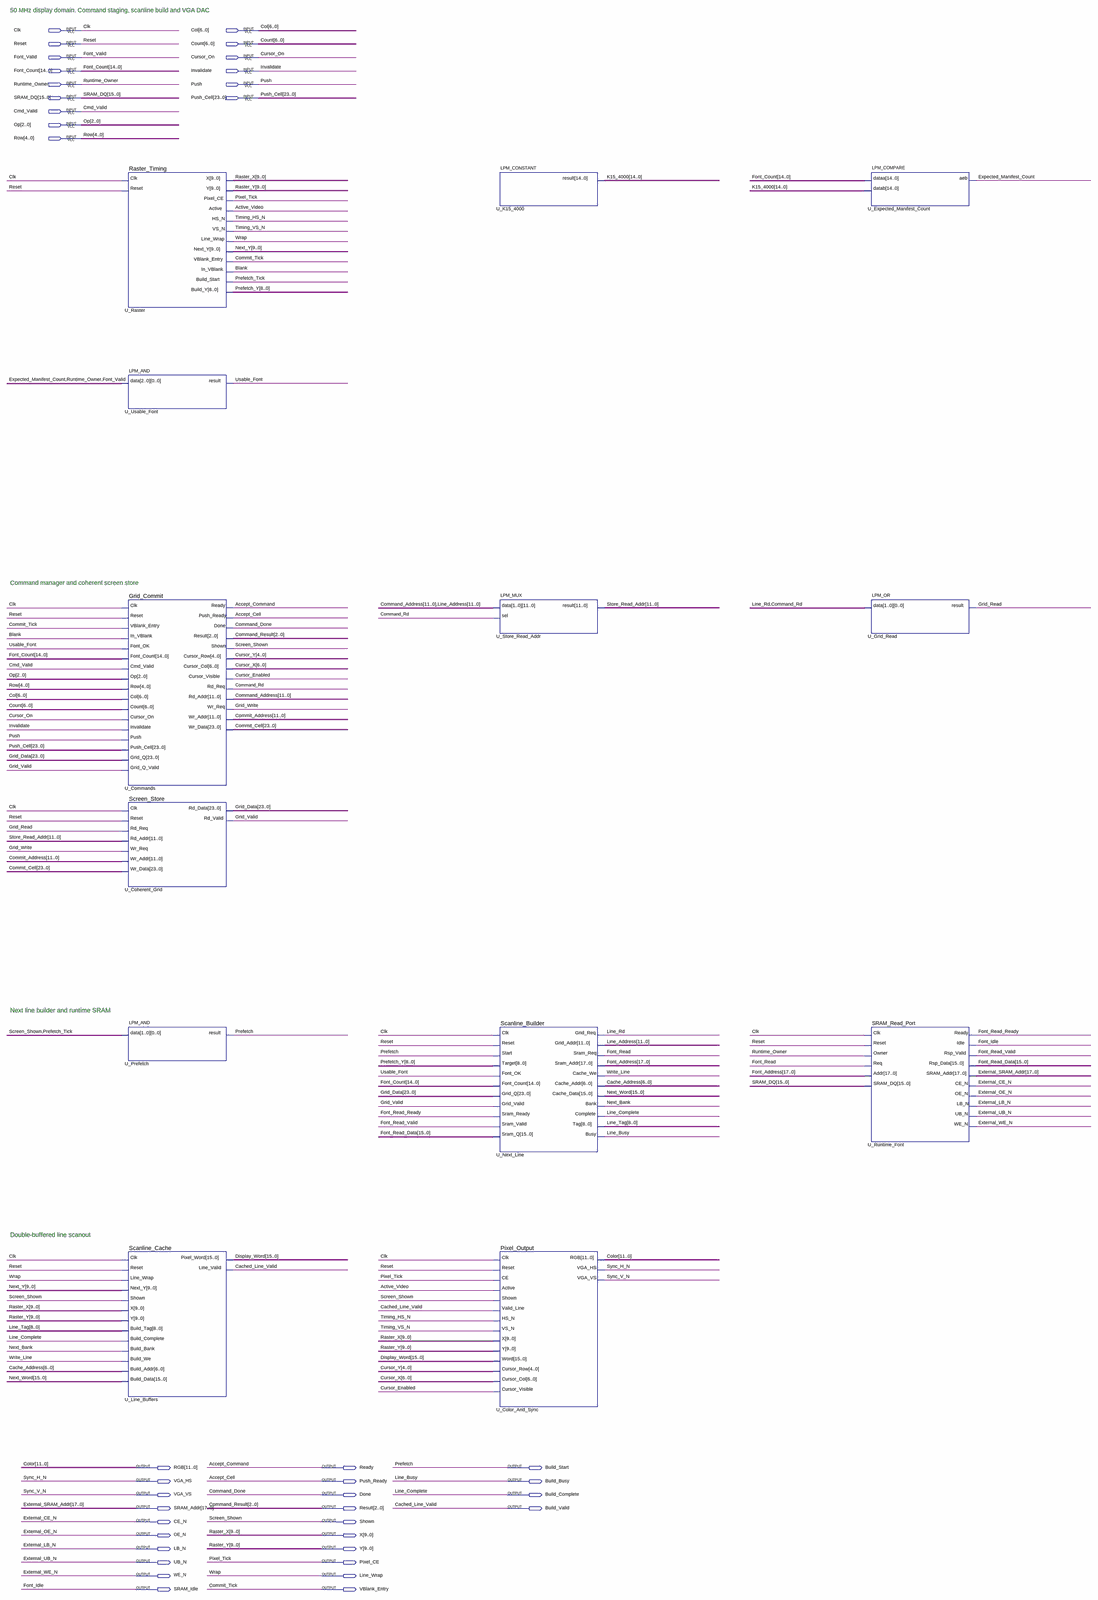
[diagram p0: schematic sheet, whole]
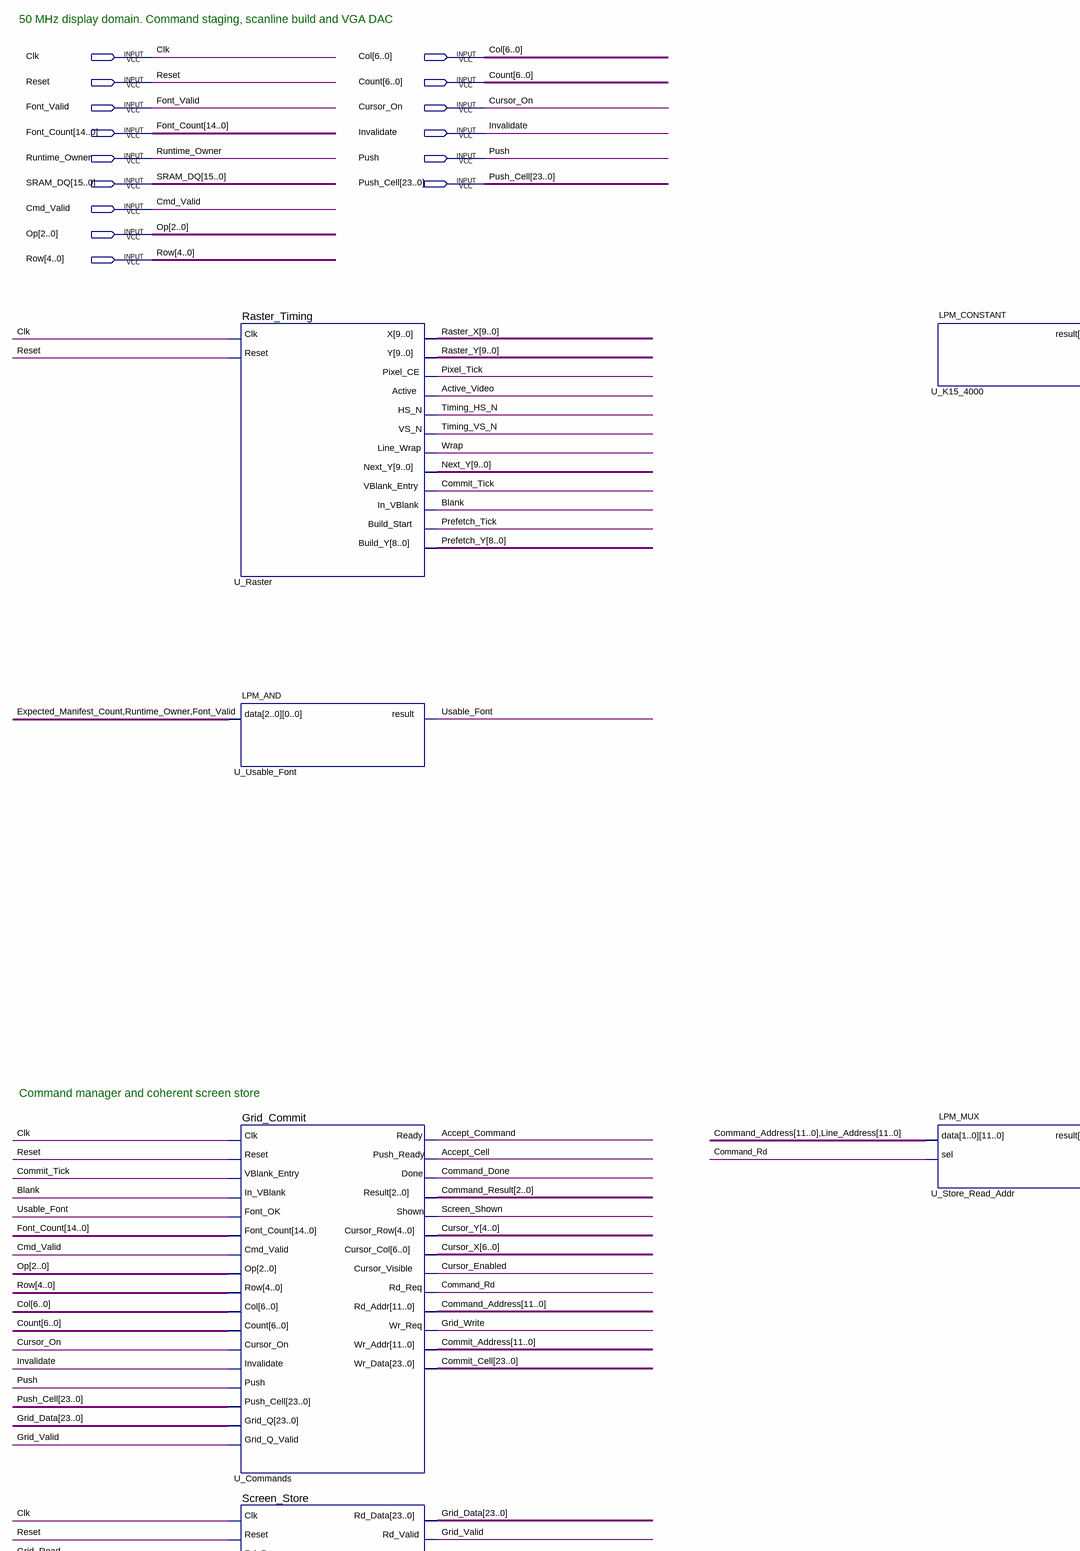
[diagram p1: schematic sheet, upper left part]
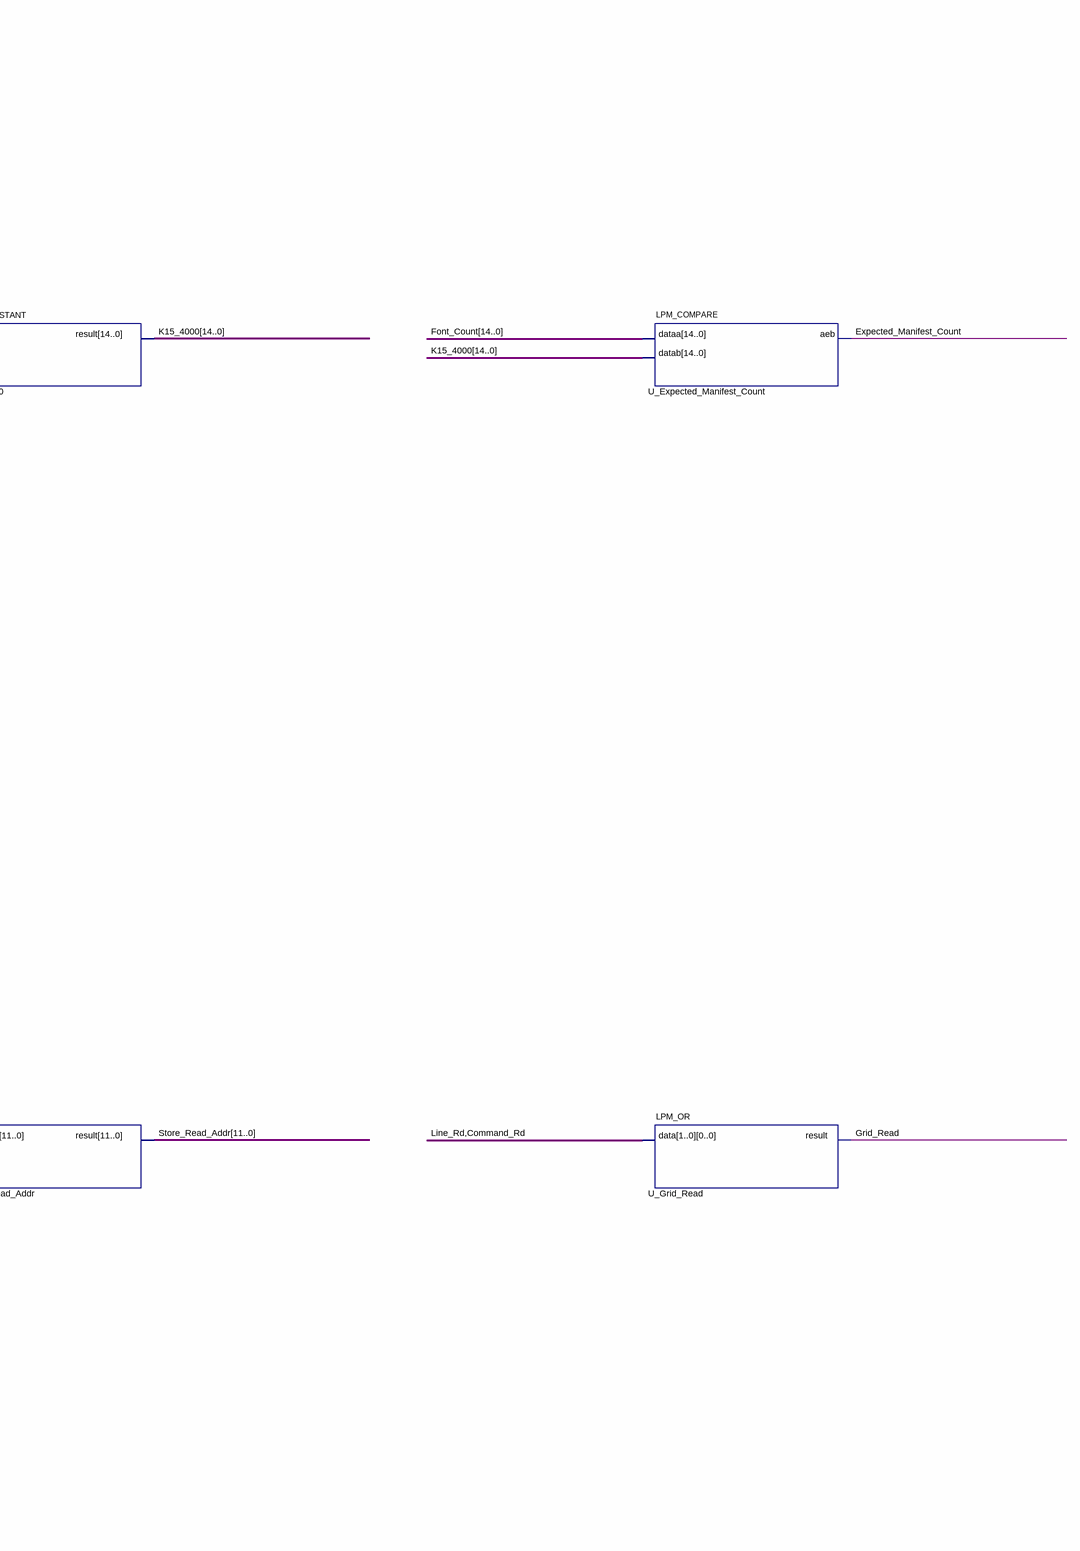
[diagram p2: schematic sheet, upper right part]
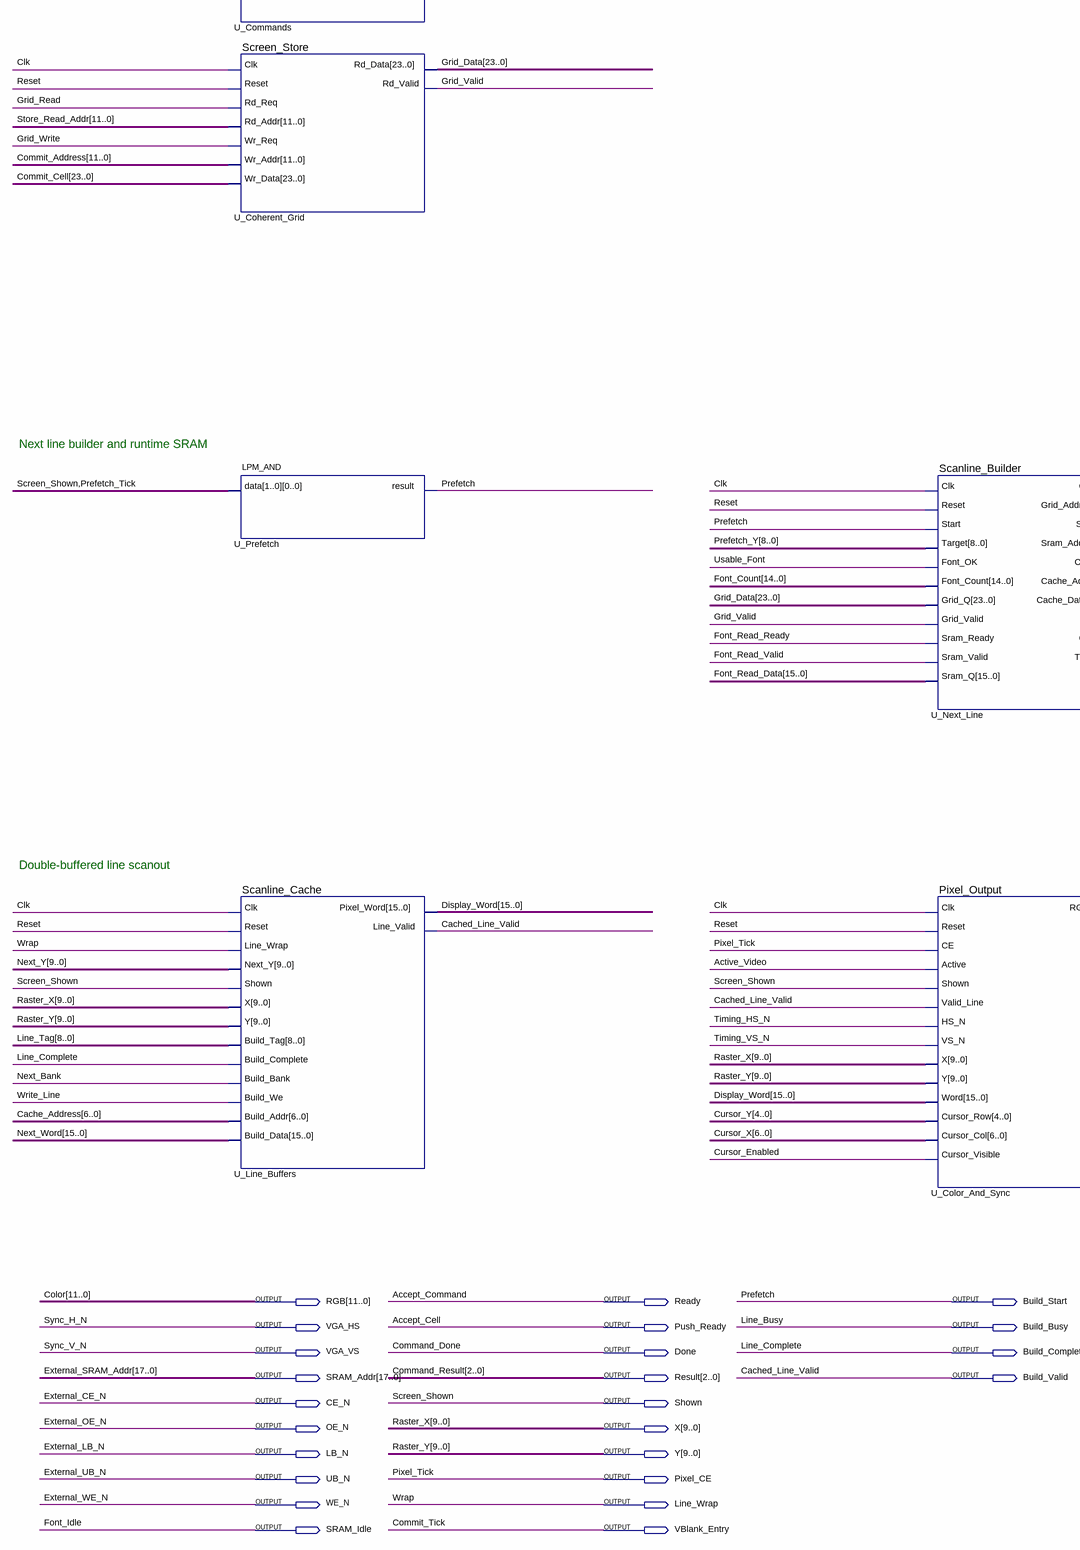
[diagram p3: schematic sheet, lower left part]
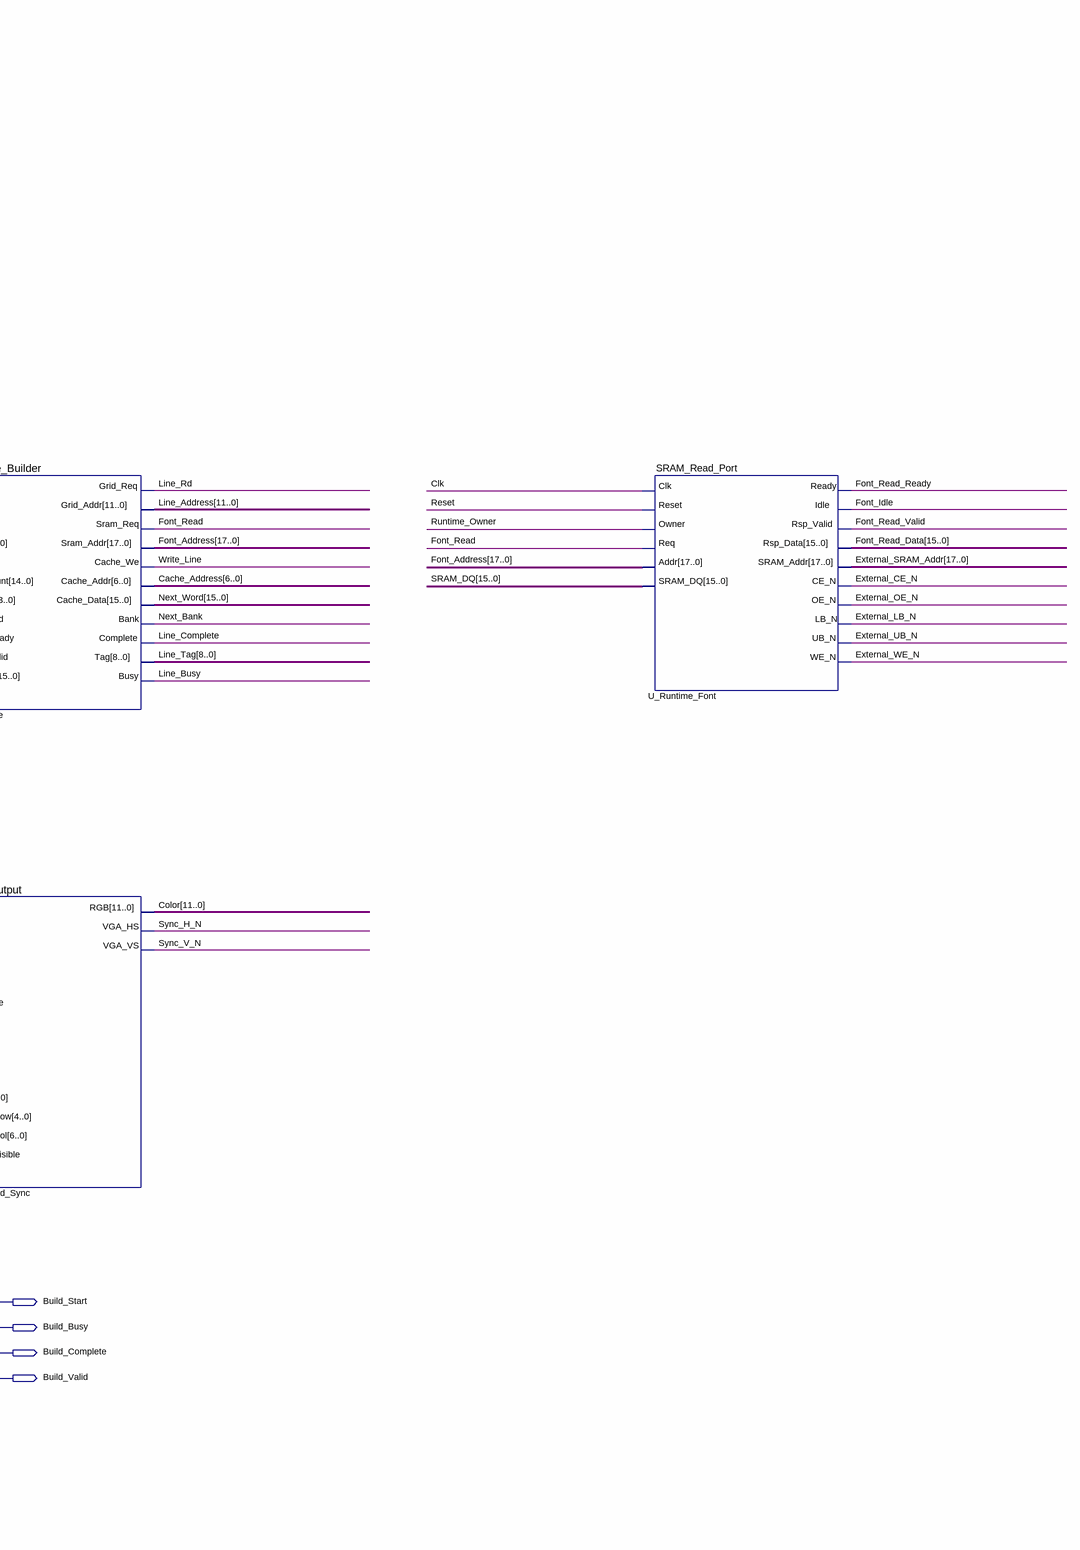
[diagram p4: schematic sheet, lower right part]
// Quartus schematic Terminal_Display.bdf as structural Verilog: 13 symbols, 39 pins
module Terminal_Display (
  input  Clk,
  input  [6:0] Col,
  input  Reset,
  input  [6:0] Count,
  input  Font_Valid,
  input  Cursor_On,
  input  [14:0] Font_Count,
  input  Invalidate,
  input  Runtime_Owner,
  input  Push,
  input  [15:0] SRAM_DQ,
  input  [23:0] Push_Cell,
  input  Cmd_Valid,
  input  [2:0] Op,
  input  [4:0] Row,
  output [11:0] RGB,
  output Ready,
  output Build_Start,
  output VGA_HS,
  output Push_Ready,
  output Build_Busy,
  output VGA_VS,
  output Done,
  output Build_Complete,
  output [17:0] SRAM_Addr,
  output [2:0] Result,
  output Build_Valid,
  output CE_N,
  output Shown,
  output OE_N,
  output [9:0] X,
  output LB_N,
  output [9:0] Y,
  output UB_N,
  output Pixel_CE,
  output WE_N,
  output Line_Wrap,
  output SRAM_Idle,
  output VBlank_Entry
);

  wire Active_Video, Blank, Command_Rd, Cursor_Enabled, Expected_Manifest_Count, Font_Read, Font_Read_Ready,
       Font_Read_Valid, Grid_Read, Grid_Valid, Grid_Write, Line_Rd, Next_Bank, Prefetch_Tick, Timing_HS_N,
       Timing_VS_N, Usable_Font, Write_Line;
  wire [4:0] Cursor_Y;
  wire [6:0] Cache_Address, Cursor_X;
  wire [8:0] Line_Tag, Prefetch_Y;
  wire [9:0] Next_Y;
  wire [11:0] Command_Address, Commit_Address, Line_Address, Store_Read_Addr;
  wire [14:0] K15_4000;
  wire [15:0] Display_Word, Font_Read_Data, Next_Word;
  wire [17:0] Font_Address;
  wire [23:0] Commit_Cell, Grid_Data;

  Raster_Timing U_Raster (
    .Clk(Clk), .Reset(Reset), .X(X), .Y(Y), .Pixel_CE(Pixel_CE), .Active(Active_Video), .HS_N(Timing_HS_N),
    .VS_N(Timing_VS_N), .Line_Wrap(Line_Wrap), .Next_Y(Next_Y), .VBlank_Entry(VBlank_Entry),
    .In_VBlank(Blank), .Build_Start(Prefetch_Tick), .Build_Y(Prefetch_Y));
  LPM_AND #(.LPM_WIDTH(1), .LPM_SIZE(3)) U_Usable_Font (
    .data({Expected_Manifest_Count, Runtime_Owner, Font_Valid}), .result(Usable_Font));
  Grid_Commit U_Commands (
    .Clk(Clk), .Reset(Reset), .VBlank_Entry(VBlank_Entry), .In_VBlank(Blank), .Font_OK(Usable_Font),
    .Font_Count(Font_Count), .Cmd_Valid(Cmd_Valid), .Op(Op), .Row(Row), .Col(Col), .Count(Count),
    .Cursor_On(Cursor_On), .Invalidate(Invalidate), .Push(Push), .Push_Cell(Push_Cell), .Grid_Q(Grid_Data),
    .Grid_Q_Valid(Grid_Valid), .Ready(Ready), .Push_Ready(Push_Ready), .Done(Done), .Result(Result),
    .Shown(Shown), .Cursor_Row(Cursor_Y), .Cursor_Col(Cursor_X), .Cursor_Visible(Cursor_Enabled),
    .Rd_Req(Command_Rd), .Rd_Addr(Command_Address), .Wr_Req(Grid_Write), .Wr_Addr(Commit_Address),
    .Wr_Data(Commit_Cell));
  Screen_Store U_Coherent_Grid (
    .Clk(Clk), .Reset(Reset), .Rd_Req(Grid_Read), .Rd_Addr(Store_Read_Addr), .Wr_Req(Grid_Write),
    .Wr_Addr(Commit_Address), .Wr_Data(Commit_Cell), .Rd_Data(Grid_Data), .Rd_Valid(Grid_Valid));
  LPM_AND #(.LPM_WIDTH(1), .LPM_SIZE(2)) U_Prefetch (.data({Shown, Prefetch_Tick}), .result(Build_Start));
  Scanline_Cache U_Line_Buffers (
    .Clk(Clk), .Reset(Reset), .Line_Wrap(Line_Wrap), .Next_Y(Next_Y), .Shown(Shown), .X(X), .Y(Y),
    .Build_Tag(Line_Tag), .Build_Complete(Build_Complete), .Build_Bank(Next_Bank), .Build_We(Write_Line),
    .Build_Addr(Cache_Address), .Build_Data(Next_Word), .Pixel_Word(Display_Word), .Line_Valid(Build_Valid));
  LPM_CONSTANT #(.LPM_WIDTH(15), .LPM_CVALUE(16384)) U_K15_4000 (.result(K15_4000));
  LPM_MUX #(.LPM_WIDTH(12), .LPM_SIZE(2), .LPM_WIDTHS(1)) U_Store_Read_Addr (
    .data({Command_Address, Line_Address}), .sel(Command_Rd), .result(Store_Read_Addr));
  Scanline_Builder U_Next_Line (
    .Clk(Clk), .Reset(Reset), .Start(Build_Start), .Target(Prefetch_Y), .Font_OK(Usable_Font),
    .Font_Count(Font_Count), .Grid_Q(Grid_Data), .Grid_Valid(Grid_Valid), .Sram_Ready(Font_Read_Ready),
    .Sram_Valid(Font_Read_Valid), .Sram_Q(Font_Read_Data), .Grid_Req(Line_Rd), .Grid_Addr(Line_Address),
    .Sram_Req(Font_Read), .Sram_Addr(Font_Address), .Cache_We(Write_Line), .Cache_Addr(Cache_Address),
    .Cache_Data(Next_Word), .Bank(Next_Bank), .Complete(Build_Complete), .Tag(Line_Tag), .Busy(Build_Busy));
  Pixel_Output U_Color_And_Sync (
    .Clk(Clk), .Reset(Reset), .CE(Pixel_CE), .Active(Active_Video), .Shown(Shown), .Valid_Line(Build_Valid),
    .HS_N(Timing_HS_N), .VS_N(Timing_VS_N), .X(X), .Y(Y), .Word(Display_Word), .Cursor_Row(Cursor_Y),
    .Cursor_Col(Cursor_X), .Cursor_Visible(Cursor_Enabled), .RGB(RGB), .VGA_HS(VGA_HS), .VGA_VS(VGA_VS));
  LPM_COMPARE #(.LPM_WIDTH(15), .LPM_REPRESENTATION("UNSIGNED")) U_Expected_Manifest_Count (
    .dataa(Font_Count), .datab(K15_4000), .aeb(Expected_Manifest_Count));
  LPM_OR #(.LPM_WIDTH(1), .LPM_SIZE(2)) U_Grid_Read (.data({Line_Rd, Command_Rd}), .result(Grid_Read));
  SRAM_Read_Port U_Runtime_Font (
    .Clk(Clk), .Reset(Reset), .Owner(Runtime_Owner), .Req(Font_Read), .Addr(Font_Address), .SRAM_DQ(SRAM_DQ),
    .Ready(Font_Read_Ready), .Idle(SRAM_Idle), .Rsp_Valid(Font_Read_Valid), .Rsp_Data(Font_Read_Data),
    .SRAM_Addr(SRAM_Addr), .CE_N(CE_N), .OE_N(OE_N), .LB_N(LB_N), .UB_N(UB_N), .WE_N(WE_N));

  // Other names for the same wires on the sheet: Accept_Cell = Push_Ready; Accept_Command = Ready;
  //   Cached_Line_Valid = Build_Valid; Color[11:0] = RGB; Command_Done = Done; Command_Result[2:0] = Result;
  //   Commit_Tick = VBlank_Entry; External_CE_N = CE_N; External_LB_N = LB_N; External_OE_N = OE_N;
  //   External_SRAM_Addr[17:0] = SRAM_Addr; External_UB_N = UB_N; External_WE_N = WE_N; Font_Idle = SRAM_Idle;
  //   Line_Busy = Build_Busy; Line_Complete = Build_Complete; Pixel_Tick = Pixel_CE; Prefetch = Build_Start;
  //   Raster_X[9:0] = X; Raster_Y[9:0] = Y; Screen_Shown = Shown; Sync_H_N = VGA_HS; Sync_V_N = VGA_VS;
  //   Wrap = Line_Wrap

  // Notes on the sheet:
  //   50 MHz display domain. Command staging, scanline build and VGA DAC
  //   Command manager and coherent screen store
  //   Next line builder and runtime SRAM
  //   Double-buffered line scanout
endmodule
